# Altium schematic sheet Power_Controller-Sheet.SchDoc (part 3 of 3)
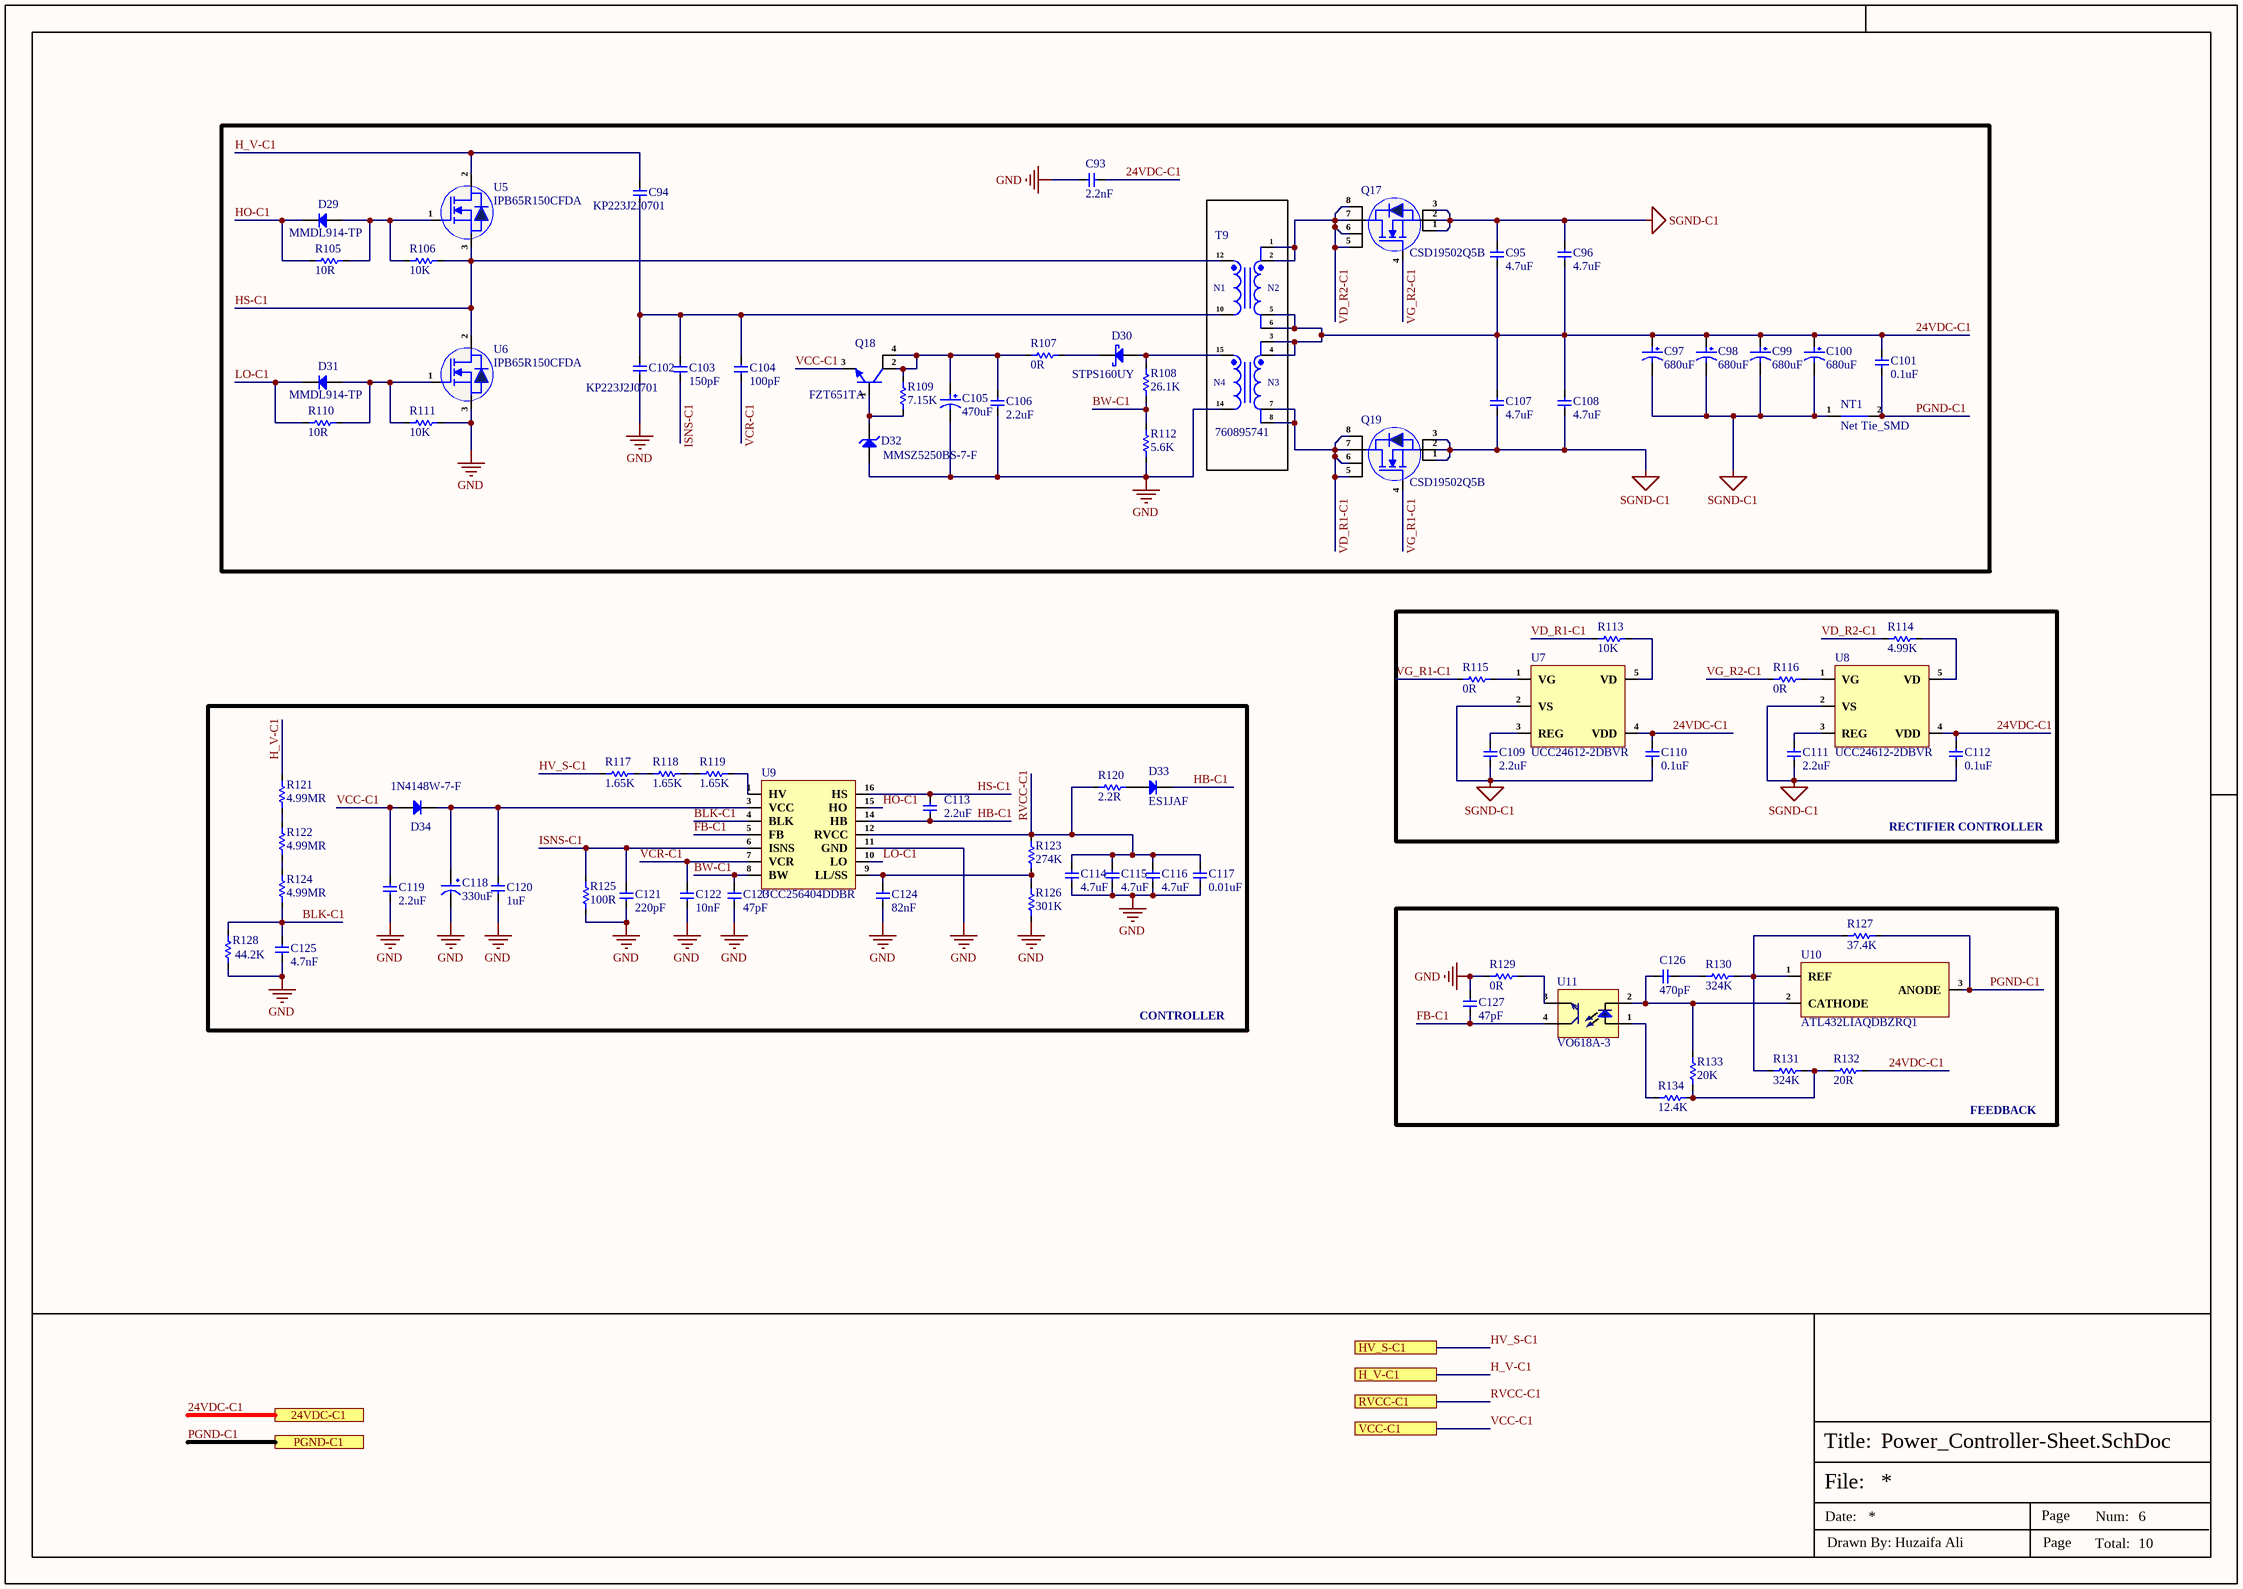
[diagram p2: Power_Controller-Sheet.SchDoc]

## Library data of the parts (continued)
R112 = CRCW08055K60FKEA: RES SMD 5.6K OHM 1% 1/8W 0805; Manufacturer: Vishay; Value: 5.6kR; Max Power Dissipation: 125mW; Temperature Coefficient: 100ppm/°C; Voltage Rating: 150V; Item Type: Resistor; Supplier: Rs; Supplier Part Number: 6791572P; Manufacturer Part Number: CRCW08055K60FKEA; RoHS: Yes; Category: Chip SMD Resistors; Stock: 100250; Pricing: 1250=0.024, 2500=0.013, 4000=0.015, 5000=0.011 (GBP); Case/Package: 0805; Pins: 2; Weight: 0.000194oz; Case Code (Imperial): 0805; Case Code (Metric): 2012; Contact Plating: Tin; Min Operating Temperature: -55°C; Max Operating Temperature: 155°C; Tolerance: 1%; Packaging: Tape and Reel; Number of Terminations: 2; Series: CRCW; Resistor Type: Thick Film; Package Quantity: 5000; Power Rating: 125mW; Termination: SMD/SMT; Voltage Rating (DC): 150V; Features: Automotive AEC-Q200; Technology: THICK FILM; Resistance Tolerance: 1%; Length: 2mm; Width: 1.25mm; Height: 0.45mm; Depth: 1.25mm; Ratings: AEC-Q200; RoHS Compliant: Yes; Reach SVHC Compliant: Unknown; ComponentLink1URL: https://datasheet.ciiva.com/11811/0900766b80d98b26-11811062.pdf?src-supplier=Rs; ComponentLink1Description: https://datasheet.ciiva.com/11811/0900766b80d98b26-11811062.pdf?src-supplier=Rs; ComponentLink2URL: https://datasheet.ciiva.com/2525/dcrcwe3-2525722.pdf?src-supplier=Digi-Key; ComponentLink2Description: https://datasheet.ciiva.com/2525/dcrcwe3-2525722.pdf?src-supplier=Digi-Key; ComponentLink3URL: https://datasheet.ciiva.com/16767/70201119-16767127.pdf?src-supplier=Allied+Electronics; ComponentLink3Description: https://datasheet.ciiva.com/16767/70201119-16767127.pdf?src-supplier=Allied+Electronics; ComponentLink4URL: https://datasheet.ciiva.com/7841/1697337-7841861.pdf?src-supplier=Element14; ComponentLink4Description: https://datasheet.ciiva.com/7841/1697337-7841861.pdf?src-supplier=Element14; ComponentLink5URL: https://datasheet.ciiva.com/26317/fld-crcw-e3-data-en-26317147.pdf?src-supplier=Distrelec; ComponentLink5Description: https://datasheet.ciiva.com/26317/fld-crcw-e3-data-en-26317147.pdf?src-supplier=Distrelec; ComponentLink6URL: https://datasheet.ciiva.com/7841/1697337-7841690.pdf?src-supplier=Element14; ComponentLink6Description: https://datasheet.ciiva.com/7841/1697337-7841690.pdf?src-supplier=Element14; ComponentLink7URL: https://datasheet.ciiva.com/22683/1847332-22683327.pdf?src-supplier=Element14; ComponentLink7Description: https://datasheet.ciiva.com/22683/1847332-22683327.pdf?src-supplier=Element14; ComponentLink8URL: https://datasheet.ciiva.com/2525/dcrcwe3-2525723.pdf?src-supplier=Digi-Key; ComponentLink8Description: https://datasheet.ciiva.com/2525/dcrcwe3-2525723.pdf?src-supplier=Digi-Key; ComponentLink9URL: https://datasheet.ciiva.com/2525/dcrcwe3-2525724.pdf?src-supplier=Digi-Key; ComponentLink9Description: https://datasheet.ciiva.com/2525/dcrcwe3-2525724.pdf?src-supplier=Digi-Key; ComponentLink10URL: https://datasheet.ciiva.com/9065/dcrcwe3-9065422.pdf?src-supplier=Avnet; ComponentLink10Description: https://datasheet.ciiva.com/9065/dcrcwe3-9065422.pdf?src-supplier=Avnet; LCSC Part Number: C844634
R113 = RK73G1JTTD1002F: RES 10K OHM 1% 1/10W 0603; Item Type: Resistor; Value: 10kR; Power Rating: 100mW; Voltage Rating: 75V; Temperature Coefficient: 50ppm/°C; LCSC Part Number: C362180; ComponentLink1Description: LCSC; Supplier: Digi-Key; Supplier Part Number: 2019-RK73G1JTTD1002FCT-ND; RoHS: Yes; Category: Chip SMD Resistors; Stock: 249394; Pricing: 1=0.22, 10=0.118, 50=0.0812, 100=0.0699, 500=0.0513, 1000=0.04545 (USD); Case/Package: 0603; Case Code (Imperial): 0603; Case Code (Metric): 1608; Min Operating Temperature: -55°C; Max Operating Temperature: 125°C; Tolerance: 1%; Packaging: Tape and Reel; Termination: SMD/SMT; Series: RK73G; Construction: Rectangular; Length: 1.6mm; Depth: 0.8mm; Military Standard: Not; RoHS Compliant: Yes; ComponentLink2URL: http://www.mouser.com/ds/2/219/RK73G-9863.pdf?src-supplier=Mouser; ComponentLink2Description: http://www.mouser.com/ds/2/219/RK73G-9863.pdf?src-supplier=Mouser
R114 = CR0603-FX-4991ELF: RES SMD 4.99K OHM 1% 1/10W 0603; Manufacturer: Bourns; Item Type: Resistor; Voltage Rating (DC): 50V; Supplier: Digikey; LCSC Part Number: C203645; Manufacturer Part Number: CR0603-FX-4991ELF; RoHS: Yes; Stock: 84955; Pricing: 1=0.1, 10=0.014, 25=0.0108, 50=0.008, 100=0.0057, 250=0.00456, 500=0.00364, 1000=0.00268 (USD); Thickness: 457um; RoHS Compliant: 5897YesNo; ComponentLink1URL: https://datasheet.ciiva.com/9122/chpreztr-9122757.pdf?src-supplier=Avnet; ComponentLink1Description: https://datasheet.ciiva.com/9122/chpreztr-9122757.pdf?src-supplier=Avnet; ComponentLink2URL: https://datasheet.ciiva.com/6547/chpreztr-6547333.pdf?src-supplier=Digikey; ComponentLink2Description: https://datasheet.ciiva.com/6547/chpreztr-6547333.pdf?src-supplier=Digikey; ComponentLink3URL: https://datasheet.ciiva.com/6547/chpreztr-6547335.pdf?src-supplier=Digikey; ComponentLink3Description: https://datasheet.ciiva.com/6547/chpreztr-6547335.pdf?src-supplier=Digikey
R115 R116 = RC0402FR-070RL: RES 0 OHM JUMPER 1/16W 0402; Manufacturer: Yageo; Item Type: Resistors; Tolerance: 1%; Power Rating: 62.5mW; Voltage Rating: 50V; Temperature Coefficient: 200ppm/°C; Max Power Dissipation: 63mW; Supplier 1: Mouser; Manufacturer Part Number: RC0402FR-070RL; RoHS: Yes; Stock 1: 8556842; Pricing 1: 1=0.10000, 10=0.01400, 50=0.01400, 100=0.00600, 1000=0.00300, 5000=0.00200, 10000=0.00100 (USD); Mount: Surface Mount; Case/Package: 0402; Contact Plating: Tin,Matte; Case Code (Imperial): 0402; Case Code (Metric): 1005; Size Code: 0402; Min Operating Temperature: -55°C; Max Operating Temperature: 155°C; Resistance: 0R; Resistor Type: Thick Film; Packaging: Tape and Reel; Termination: SMD/SMT; Features: Moisture Resistant; Series: RC; Number of Terminations: 2; Length: 1mm; Width: 0.5mm; Height: 0.35mm; Radiation Hardening: No; Lead Free: Lead Free; RoHS Compliant: Yes; ComponentLink1URL: https://datasheet.ciiva.com/8896/pyu-rc0402-51-rohs-l-6-8896149.pdf?src-supplier=Avnet; ComponentLink1Description: https://datasheet.ciiva.com/8896/pyu-rc0402-51-rohs-l-6-8896149.pdf?src-supplier=Avnet; ComponentLink2URL: https://datasheet.ciiva.com/16790/pyu-rc0402-51-rohs-l-6-r-16790444.pdf?src-supplier=Future+Electronics; ComponentLink2Description: https://datasheet.ciiva.com/16790/pyu-rc0402-51-rohs-l-6-r-16790444.pdf?src-supplier=Future+Electronics; Supplier Part Number 1: 603-RC0402FR-070RL; LCSC Part Number: C106231
R117-R119 = RC1206FR-071K65L: RES 1.65K OHM 1% 1/4W 1206; Manufacturer: Yageo; Item Type: Resistor; Supplier: Digikey; LCSC Part Number: C488588; Manufacturer Part Number: RC1206FR-071K65L; RoHS: Yes; Stock: 18321; Pricing: 1=0.1, 10=0.038, 50=0.0244, 100=0.0206, 500=0.01434, 1000=0.01248 (USD); ComponentLink1URL: https://datasheet.ciiva.com/15159/getdatasheetpartid-45723-15159541.pdf?src-supplier=Verical; ComponentLink1Description: https://datasheet.ciiva.com/15159/getdatasheetpartid-45723-15159541.pdf?src-supplier=Verical; ComponentLink2URL: https://datasheet.ciiva.com/17086/pyu-rc1206-51-rohs-l-4-17086185.pdf?src-supplier=Future+Electronics; ComponentLink2Description: https://datasheet.ciiva.com/17086/pyu-rc1206-51-rohs-l-4-17086185.pdf?src-supplier=Future+Electronics
R120 = RC0603FR-072R2L: RES 2.2 OHM 1% 1/10W 0603; Manufacturer: Yageo; Item Type: Resistors; Voltage Rating: 50V; Power Rating: 100mW; Temperature Coefficient: 200ppm/°C; Supplier: Digikey; LCSC Part Number: C112307; Manufacturer Part Number: RC0603FR-072R2L; RoHS: Yes; Stock: 331140; Pricing: 1=0.1, 10=0.029, 50=0.0188, 100=0.0158, 500=0.01094, 1000=0.00947 (USD); Case/Package: 0603; Pins: 2; Case Code (Metric): 1608; Case Code (Imperial): 0603; Min Operating Temperature: -55°C; Max Operating Temperature: 155°C; Voltage Rating (DC): 50V; Package Quantity: 1; Value: 2.2R; Tolerance: 1%; Packaging: Tape and Reel; Resistor Type: Thick Film; Number of Terminations: 2; Termination: SMD/SMT; Max Power Dissipation: 100mW; Features: Moisture Resistant; Series: RC; Technology: THICK FILM; Resistance Tolerance: 1%; Length: 0.063inch; Width: 0.031inch; Height: 0.022inch; Depth: 0.8mm; Reach SVHC Compliant: No; Lead Free: Lead Free; RoHS Compliant: Yes; ComponentLink1URL: https://datasheet.ciiva.com/11808/0900766b80f96399-11808160.pdf?src-supplier=Rs; ComponentLink1Description: https://datasheet.ciiva.com/11808/0900766b80f96399-11808160.pdf?src-supplier=Rs; ComponentLink2URL: https://datasheet.ciiva.com/2554/pyu-r-int-thick-7-2554421.pdf?src-supplier=Digikey; ComponentLink2Description: https://datasheet.ciiva.com/2554/pyu-r-int-thick-7-2554421.pdf?src-supplier=Digikey; ComponentLink3URL: https://datasheet.ciiva.com/2554/pyu-r-int-thick-7-2554422.pdf?src-supplier=Digikey; ComponentLink3Description: https://datasheet.ciiva.com/2554/pyu-r-int-thick-7-2554422.pdf?src-supplier=Digikey; ComponentLink4URL: https://datasheet.ciiva.com/2554/pyu-r-int-thick-7-2554420.pdf?src-supplier=Digikey; ComponentLink4Description: https://datasheet.ciiva.com/2554/pyu-r-int-thick-7-2554420.pdf?src-supplier=Digikey
R121 R122 R124 = RC1206FR-074M99L: RES 4.99M OHM 1% 1/4W 1206; Manufacturer: Yageo; Item Type: Resistors; Temperature Coefficient: 100ppm/°C; Power Rating: 250mW; Voltage Rating: 200V; Supplier: Digikey; LCSC Part Number: C488845; Manufacturer Part Number: RC1206FR-074M99L; RoHS: Yes; Stock: 11560; Pricing: 1=0.1, 10=0.038, 50=0.0244, 100=0.0206, 500=0.01434, 1000=0.01248 (USD); Case/Package: 1206; Contact Plating: Tin,Matte; Case Code (Imperial): 1206; Case Code (Metric): 3216; Min Operating Temperature: -55°C; Max Operating Temperature: 155°C; Tolerance: 1%; Value: 4.99MR; Package Quantity: 1; Packaging: Tape and Reel; Termination: SMD/SMT; Number of Terminations: 2; Max Power Dissipation: 250mW; Voltage Rating (DC): 200V; Features: Moisture Resistant; Series: RC; Length: 0.122inch; Width: 0.063inch; Height: 0.026inch; Lead Free: Lead Free; RoHS Compliant: Yes; ComponentLink1URL: https://datasheet.ciiva.com/2521/pyu-rc1206-51-rohs-l-4-2521020.pdf?src-supplier=Digikey; ComponentLink1Description: https://datasheet.ciiva.com/2521/pyu-rc1206-51-rohs-l-4-2521020.pdf?src-supplier=Digikey; ComponentLink2URL: https://datasheet.ciiva.com/2521/pyu-rc1206-51-rohs-l-4-2521021.pdf?src-supplier=Digikey; ComponentLink2Description: https://datasheet.ciiva.com/2521/pyu-rc1206-51-rohs-l-4-2521021.pdf?src-supplier=Digikey; ComponentLink3URL: https://datasheet.ciiva.com/2521/pyu-rc1206-51-rohs-l-4-2521019.pdf?src-supplier=Digikey; ComponentLink3Description: https://datasheet.ciiva.com/2521/pyu-rc1206-51-rohs-l-4-2521019.pdf?src-supplier=Digikey
R123 = RC0603FR-07274KL: RES 274K OHM 1% 1/10W 0603; Manufacturer: Yageo; Item Type: Resistors; Supplier: Digikey; LCSC Part Number: C482818; Manufacturer Part Number: RC0603FR-07274KL; RoHS: Yes; Stock: 204071; Pricing: 1=0.1, 10=0.019, 50=0.0114, 100=0.0094, 500=0.00632, 1000=0.0054 (USD); ComponentLink1URL: https://datasheet.ciiva.com/2454/pyu-r-int-thick-7-2454960.pdf?src-supplier=Digikey; ComponentLink1Description: https://datasheet.ciiva.com/2454/pyu-r-int-thick-7-2454960.pdf?src-supplier=Digikey; ComponentLink2URL: https://datasheet.ciiva.com/2454/pyu-r-int-thick-7-2454961.pdf?src-supplier=Digikey; ComponentLink2Description: https://datasheet.ciiva.com/2454/pyu-r-int-thick-7-2454961.pdf?src-supplier=Digikey; ComponentLink3URL: https://datasheet.ciiva.com/2454/pyu-r-int-thick-7-2454962.pdf?src-supplier=Digikey; ComponentLink3Description: https://datasheet.ciiva.com/2454/pyu-r-int-thick-7-2454962.pdf?src-supplier=Digikey
R125 = CRCW0603100RFKEA: RES SMD 100 OHM 1% 1/10W 0603; Manufacturer: Vishay Dale; Item Type: Resistors; Power Rating: 100mW; Voltage Rating: 75V; Temperature Coefficient: 100ppm/°C; Supplier: Mouser; LCSC Part Number: C844917; Manufacturer Part Number: CRCW0603100RFKEA; RoHS: Yes; Stock: 584918; Pricing: 1=0.1, 10=0.017, 50=0.017, 100=0.01, 1000=0.008, 10000=0.004 (USD); Case/Package: 0603; Pins: 2NUMBER; Weight: 7.1E-05oz; Case Code (Metric): 1608; Case Code (Imperial): 0603; Min Operating Temperature: -55°C; Max Operating Temperature: 155°C; Value: 100R; Tolerance: 1%; Resistor Type: Thick Film; Package Quantity: 10; Packaging: Tape and Reel; Number of Terminations: 2; Termination: SMD/SMT; Max Power Dissipation: 100mW; Features: Automotive AEC-Q200; Series: CRCW; Resistance Tolerance: 1%; Voltage Rating (DC): 75V; Construction: Rectangular; Length: 1.55mm; Width: 0.033inch; Height: 0.02inch; Depth: 0.85mm; Ratings: AEC-Q200; Lead Free: 5697LeadFree; RoHS Compliant: Yes; Reach SVHC Compliant: Unknown; Military Standard: Not; ComponentLink1URL: https://datasheet.ciiva.com/22666/1720486-22666207.pdf?src-supplier=Element14; ComponentLink1Description: https://datasheet.ciiva.com/22666/1720486-22666207.pdf?src-supplier=Element14; ComponentLink2URL: https://datasheet.ciiva.com/26316/fld-crcw-e3-data-en-26316566.pdf?src-supplier=Distrelec; ComponentLink2Description: https://datasheet.ciiva.com/26316/fld-crcw-e3-data-en-26316566.pdf?src-supplier=Distrelec; ComponentLink3URL: https://datasheet.ciiva.com/22673/1697337-22673066.pdf?src-supplier=Element14; ComponentLink3Description: https://datasheet.ciiva.com/22673/1697337-22673066.pdf?src-supplier=Element14; ComponentLink4URL: https://datasheet.ciiva.com/2465/dcrcwe3-2465544.pdf?src-supplier=Digikey; ComponentLink4Description: https://datasheet.ciiva.com/2465/dcrcwe3-2465544.pdf?src-supplier=Digikey; ComponentLink5URL: https://datasheet.ciiva.com/2465/dcrcwe3-2465545.pdf?src-supplier=Digikey; ComponentLink5Description: https://datasheet.ciiva.com/2465/dcrcwe3-2465545.pdf?src-supplier=Digikey; ComponentLink6URL: https://datasheet.ciiva.com/2465/dcrcwe3-2465543.pdf?src-supplier=Digikey; ComponentLink6Description: https://datasheet.ciiva.com/2465/dcrcwe3-2465543.pdf?src-supplier=Digikey; ComponentLink7URL: https://datasheet.ciiva.com/16721/70201119-16721486.pdf?src-supplier=Allied+Electronics; ComponentLink7Description: https://datasheet.ciiva.com/16721/70201119-16721486.pdf?src-supplier=Allied+Electronics; ComponentLink8URL: https://datasheet.ciiva.com/16787/70201119-16787964.pdf?src-supplier=Allied+Electronics; ComponentLink8Description: https://datasheet.ciiva.com/16787/70201119-16787964.pdf?src-supplier=Allied+Electronics; ComponentLink9URL: https://datasheet.ciiva.com/5550/dcrcwe3-109170-5550286.pdf?src-supplier=Mouser; ComponentLink9Description: https://datasheet.ciiva.com/5550/dcrcwe3-109170-5550286.pdf?src-supplier=Mouser; ComponentLink10URL: https://datasheet.ciiva.com/16199/dcrcwe3-16199102.pdf?src-supplier=Future+Electronics; ComponentLink10Description: https://datasheet.ciiva.com/16199/dcrcwe3-16199102.pdf?src-supplier=Future+Electronics
R126 = RT0603BRE07301KL: RES SMD 301K OHM 0.1% 1/10W 0603; Manufacturer: Yageo; Resistance: 301kR; Max Power Dissipation: 100mW; Temperature Coefficient: 50ppm/°C; Voltage Rating (DC): 50V; Item Type: Resistor; Supplier 1: Mouser; Manufacturer Part Number: RT0603BRE07301KL; RoHS: Yes; Category: Chip SMD Resistors; Stock 1: 2800; Pricing 1: 1=0.42000, 10=0.30200, 50=0.30200, 100=0.12100, 1000=0.06000, 10000=0.04900 (USD); Case/Package: 0603; Min Operating Temperature: -55°C; Max Operating Temperature: 125°C; Package Quantity: 5000; Packaging: Tape and Reel; Tolerance: 0.1%; Resistor Type: Thin Film; Number of Terminations: 2; Series: RT; Length: 0.063inch; Width: 0.031inch; Height: 0.022inch; Lead Free: Lead Free; RoHS Compliant: Yes; ComponentLink1URL: https://datasheet.ciiva.com/2584/pyu-rt-1-to-0-05-rohs-l-5-2584420.pdf?src-supplier=Digi-Key; ComponentLink1Description: https://datasheet.ciiva.com/2584/pyu-rt-1-to-0-05-rohs-l-5-2584420.pdf?src-supplier=Digi-Key; Supplier Part Number 1: 603-RT0603BRE07301KL; LCSC Part Number: C326750
R127 = CRCW060337K4FKEA: RES SMD 37.4K OHM 1% 1/10W 0603; Manufacturer: Vishay; Item Type: Resistor; Supplier: Digikey; LCSC Part Number: C844359; Manufacturer Part Number: CRCW060337K4FKEA; RoHS: Yes; Stock: 9664; Pricing: 1=0.1, 10=0.026, 50=0.0166, 100=0.014, 500=0.00954, 1000=0.00824 (USD); ComponentLink1URL: https://datasheet.ciiva.com/5541/dcrcwe3-109170-5541061.pdf?src-supplier=Mouser; ComponentLink1Description: https://datasheet.ciiva.com/5541/dcrcwe3-109170-5541061.pdf?src-supplier=Mouser; ComponentLink2URL: https://datasheet.ciiva.com/22705/1697337-22705851.pdf?src-supplier=Element14; ComponentLink2Description: https://datasheet.ciiva.com/22705/1697337-22705851.pdf?src-supplier=Element14; ComponentLink3URL: https://datasheet.ciiva.com/16770/70201119-16770680.pdf?src-supplier=Allied+Electronics; ComponentLink3Description: https://datasheet.ciiva.com/16770/70201119-16770680.pdf?src-supplier=Allied+Electronics; ComponentLink4URL: https://datasheet.ciiva.com/7671/1697337-7671645.pdf?src-supplier=Element14; ComponentLink4Description: https://datasheet.ciiva.com/7671/1697337-7671645.pdf?src-supplier=Element14; ComponentLink5URL: https://datasheet.ciiva.com/7671/1697337-7671646.pdf?src-supplier=Element14; ComponentLink5Description: https://datasheet.ciiva.com/7671/1697337-7671646.pdf?src-supplier=Element14; ComponentLink6URL: https://datasheet.ciiva.com/3257/dcrcwe3-3257503.pdf?src-supplier=Avnet; ComponentLink6Description: https://datasheet.ciiva.com/3257/dcrcwe3-3257503.pdf?src-supplier=Avnet; ComponentLink7URL: https://datasheet.ciiva.com/7792/125364-7792237.pdf?src-supplier=Element14; ComponentLink7Description: https://datasheet.ciiva.com/7792/125364-7792237.pdf?src-supplier=Element14; ComponentLink8URL: https://datasheet.ciiva.com/16203/dcrcwe3-16203015.pdf?src-supplier=Future+Electronics; ComponentLink8Description: https://datasheet.ciiva.com/16203/dcrcwe3-16203015.pdf?src-supplier=Future+Electronics; ComponentLink9URL: https://datasheet.ciiva.com/2465/dcrcwe3-2465762.pdf?src-supplier=Digikey; ComponentLink9Description: https://datasheet.ciiva.com/2465/dcrcwe3-2465762.pdf?src-supplier=Digikey; ComponentLink10URL: https://datasheet.ciiva.com/2465/dcrcwe3-2465763.pdf?src-supplier=Digikey; ComponentLink10Description: https://datasheet.ciiva.com/2465/dcrcwe3-2465763.pdf?src-supplier=Digikey; ComponentLink11URL: https://datasheet.ciiva.com/2465/dcrcwe3-2465764.pdf?src-supplier=Digikey; ComponentLink11Description: https://datasheet.ciiva.com/2465/dcrcwe3-2465764.pdf?src-supplier=Digikey; ComponentLink12URL: https://datasheet.ciiva.com/8337/dcrcwe3-8337085.pdf?src-supplier=Avnet; ComponentLink12Description: https://datasheet.ciiva.com/8337/dcrcwe3-8337085.pdf?src-supplier=Avnet
R128 = CRCW060344K2FKEA: RES SMD 44.2K OHM 1% 1/10W 0603; Manufacturer: Vishay; Item Type: Resistor; Voltage Rating (DC): 75V; Supplier: Digikey; LCSC Part Number: C844365; Manufacturer Part Number: CRCW060344K2FKEA; RoHS: Yes; Stock: 24979; Pricing: 1=0.1, 10=0.026, 50=0.0166, 100=0.014, 500=0.00954, 1000=0.00824 (USD); Lead Free: 5697LeadFree; ComponentLink1URL: https://datasheet.ciiva.com/11812/0900766b80d98afc-11812612.pdf?src-supplier=Rs; ComponentLink1Description: https://datasheet.ciiva.com/11812/0900766b80d98afc-11812612.pdf?src-supplier=Rs; ComponentLink2URL: https://datasheet.ciiva.com/2466/dcrcwe3-2466281.pdf?src-supplier=Digikey; ComponentLink2Description: https://datasheet.ciiva.com/2466/dcrcwe3-2466281.pdf?src-supplier=Digikey; ComponentLink3URL: https://datasheet.ciiva.com/2466/dcrcwe3-2466282.pdf?src-supplier=Digikey; ComponentLink3Description: https://datasheet.ciiva.com/2466/dcrcwe3-2466282.pdf?src-supplier=Digikey; ComponentLink4URL: https://datasheet.ciiva.com/2466/dcrcwe3-2466283.pdf?src-supplier=Digikey; ComponentLink4Description: https://datasheet.ciiva.com/2466/dcrcwe3-2466283.pdf?src-supplier=Digikey; ComponentLink5URL: https://datasheet.ciiva.com/15159/getdatasheetpartid-52050-15159597.pdf?src-supplier=Verical; ComponentLink5Description: https://datasheet.ciiva.com/15159/getdatasheetpartid-52050-15159597.pdf?src-supplier=Verical; ComponentLink6URL: https://datasheet.ciiva.com/16507/dcrcwe3-16507773.pdf?src-supplier=Future+Electronics; ComponentLink6Description: https://datasheet.ciiva.com/16507/dcrcwe3-16507773.pdf?src-supplier=Future+Electronics; ComponentLink7URL: https://datasheet.ciiva.com/22705/1697337-22705852.pdf?src-supplier=Element14; ComponentLink7Description: https://datasheet.ciiva.com/22705/1697337-22705852.pdf?src-supplier=Element14; ComponentLink8URL: https://datasheet.ciiva.com/7671/1697337-7671657.pdf?src-supplier=Element14; ComponentLink8Description: https://datasheet.ciiva.com/7671/1697337-7671657.pdf?src-supplier=Element14; ComponentLink9URL: https://datasheet.ciiva.com/7671/1697337-7671658.pdf?src-supplier=Element14; ComponentLink9Description: https://datasheet.ciiva.com/7671/1697337-7671658.pdf?src-supplier=Element14; ComponentLink10URL: https://datasheet.ciiva.com/16772/70201119-16772373.pdf?src-supplier=Allied+Electronics; ComponentLink10Description: https://datasheet.ciiva.com/16772/70201119-16772373.pdf?src-supplier=Allied+Electronics; ComponentLink11URL: https://datasheet.ciiva.com/22872/70201119-22872024.pdf?src-supplier=Allied+Electronics; ComponentLink11Description: https://datasheet.ciiva.com/22872/70201119-22872024.pdf?src-supplier=Allied+Electronics
R129 = RC0603JR-070RL: RES 0 OHM JUMPER 1/10W 0603; Manufacturer: Yageo; Resistance: 0mR; Tolerance: 1%; Power Rating: 100mW; Voltage Rating (DC): 50V; Temperature Coefficient: 200ppm/°C; Resistance Tolerance: 5%; Item Type: Resistor; Supplier 1: Digi-Key; Manufacturer Part Number: RC0603JR-070RL; RoHS: Yes; Category: Chip SMD Resistors; Stock 1: 18081776; Pricing 1: 1=0.10000, 10=0.01700, 25=0.01240, 50=0.00960, 100=0.00700, 250=0.00536, 500=0.00430, 1000=0.00316 (USD); Case/Package: 0603; Number of Pins: 2; Contact Plating: Tin,Matte; Case Code (Imperial): 0603; Case Code (Metric): 1608; Size Code: 0603; Min Operating Temperature: -55°C; Max Operating Temperature: 155°C; Resistor Type: Thick Film; Packaging: Tape and Reel; Termination: SMD/SMT; Series: RC; Technology: THICK FILM; Package Quantity: 5000; Voltage Rating: 50V; Features: Moisture Resistant; Max Power Dissipation: 100mW; Number of Terminations: 2; Construction: Rectangular; Length: 1.6mm; Width: 0.8mm; Height: 0.45mm; Depth: 0.8mm; Radiation Hardening: No; Reach SVHC Compliant: No SVHC; Lead Free: Lead Free; RoHS Compliant: Yes; Military Standard: Not; Supplier Part Number 1: 311-0.0GRCT-ND; LCSC Part Number: C95177
R130 R131 = AC0603FR-07324KL: RES SMD 324K OHM 1% 1/10W 0603; Manufacturer: Yageo; Item Type: Resistors; Value: 324kR; Power Rating: 100mW; Voltage Rating: 50V; Temperature Coefficient: 100ppm/°C; Supplier: Digikey; LCSC Part Number: C227818; Manufacturer Part Number: AC0603FR-07324KL; RoHS: Yes; Stock: 5000; Pricing: 1=0.1, 10=0.021, 50=0.013, 100=0.0108, 500=0.00734, 1000=0.00633 (USD); Case/Package: 0603; Case Code (Metric): 1608; Case Code (Imperial): 0603; Min Operating Temperature: -55°C; Max Operating Temperature: 155°C; Package Quantity: 1; Tolerance: 1%; Packaging: Tape and Reel; Number of Terminations: 2; Termination: SMD/SMT; Max Power Dissipation: 100mW; Features: Moisture Resistant,Automotive AEC-Q200,Anti-Sulfur; Series: AC; Length: 0.063inch; Width: 0.031inch; Height: 0.022inch; RoHS Compliant: Yes; ComponentLink1URL: http://www.mouser.com/ds/2/447/yageodocoutput-1111992.pdf?src-supplier=Mouser; ComponentLink1Description: http://www.mouser.com/ds/2/447/yageodocoutput-1111992.pdf?src-supplier=Mouser; ComponentLink2URL: https://www.yageo.com/upload/media/product/productsearch/datasheet/rchip/PYu-AC_51_RoHS_L_7.pdf?src-supplier=Digikey; ComponentLink2Description: https://www.yageo.com/upload/media/product/productsearch/datasheet/rchip/PYu-AC_51_RoHS_L_7.pdf?src-supplier=Digikey
R132 = CRCW060320R0FKEA: RES SMD 20 OHM 1% 1/10W 0603; Manufacturer: Vishay; Item Type: Resistors; Temperature Coefficient: 100ppm/°C; Power Rating: 100mW; Voltage Rating: 75V; Supplier: Digikey; LCSC Part Number: C844755; Manufacturer Part Number: CRCW060320R0FKEA; RoHS: Yes; Stock: 100733; Pricing: 1=0.1, 10=0.026, 50=0.0166, 100=0.014, 500=0.00954, 1000=0.00824 (USD); Case/Package: 0603; Contact Plating: Tin; Weight: 7.1E-05oz; Case Code (Imperial): 0603; Case Code (Metric): 1608; Min Operating Temperature: -55°C; Max Operating Temperature: 155°C; Value: 20R; Tolerance: 1%; Resistor Type: Thick Film; Package Quantity: 10; Packaging: Tape and Reel; Number of Terminations: 2; Termination: SMD/SMT; Max Power Dissipation: 100mW; Voltage Rating (DC): 75V; Features: Automotive AEC-Q200; Series: CRCW; Technology: THICK FILM; Resistance Tolerance: 1%; Construction: Rectangular; Length: 1.55mm; Width: 0.033inch; Height: 0.45mm; Depth: 0.85mm; Ratings: AEC-Q200; Radiation Hardening: No; Lead Free: Lead Free; RoHS Compliant: Yes; Military Standard: Not; Reach SVHC Compliant: Unknown; ComponentLink1URL: https://datasheet.ciiva.com/11810/0900766b80d98afc-11810778.pdf?src-supplier=Rs; ComponentLink1Description: https://datasheet.ciiva.com/11810/0900766b80d98afc-11810778.pdf?src-supplier=Rs; ComponentLink2URL: https://datasheet.ciiva.com/7748/1533075-7748858.pdf?src-supplier=Element14; ComponentLink2Description: https://datasheet.ciiva.com/7748/1533075-7748858.pdf?src-supplier=Element14; ComponentLink3URL: https://datasheet.ciiva.com/2465/dcrcwe3-2465673.pdf?src-supplier=Digikey; ComponentLink3Description: https://datasheet.ciiva.com/2465/dcrcwe3-2465673.pdf?src-supplier=Digikey; ComponentLink4URL: https://datasheet.ciiva.com/2465/dcrcwe3-2465674.pdf?src-supplier=Digikey; ComponentLink4Description: https://datasheet.ciiva.com/2465/dcrcwe3-2465674.pdf?src-supplier=Digikey; ComponentLink5URL: https://datasheet.ciiva.com/16776/70201119-16776202.pdf?src-supplier=Allied+Electronics; ComponentLink5Description: https://datasheet.ciiva.com/16776/70201119-16776202.pdf?src-supplier=Allied+Electronics; ComponentLink6URL: https://datasheet.ciiva.com/26316/fld-crcw-e3-data-en-26316589.pdf?src-supplier=Distrelec; ComponentLink6Description: https://datasheet.ciiva.com/26316/fld-crcw-e3-data-en-26316589.pdf?src-supplier=Distrelec; ComponentLink7URL: https://datasheet.ciiva.com/2465/dcrcwe3-2465672.pdf?src-supplier=Digikey; ComponentLink7Description: https://datasheet.ciiva.com/2465/dcrcwe3-2465672.pdf?src-supplier=Digikey; ComponentLink8URL: https://datasheet.ciiva.com/16788/70201119-16788011.pdf?src-supplier=Allied+Electronics; ComponentLink8Description: https://datasheet.ciiva.com/16788/70201119-16788011.pdf?src-supplier=Allied+Electronics; ComponentLink9URL: https://datasheet.ciiva.com/5548/dcrcwe3-109170-5548022.pdf?src-supplier=Mouser; ComponentLink9Description: https://datasheet.ciiva.com/5548/dcrcwe3-109170-5548022.pdf?src-supplier=Mouser; ComponentLink10URL: https://datasheet.ciiva.com/3257/dcrcwe3-3257244.pdf?src-supplier=Avnet; ComponentLink10Description: https://datasheet.ciiva.com/3257/dcrcwe3-3257244.pdf?src-supplier=Avnet; ComponentLink11URL: https://datasheet.ciiva.com/16374/dcrcwe3-16374634.pdf?src-supplier=Future+Electronics; ComponentLink11Description: https://datasheet.ciiva.com/16374/dcrcwe3-16374634.pdf?src-supplier=Future+Electronics; ComponentLink12URL: https://datasheet.ciiva.com/3257/dcrcwe3-3257243.pdf?src-supplier=Avnet; ComponentLink12Description: https://datasheet.ciiva.com/3257/dcrcwe3-3257243.pdf?src-supplier=Avnet
R133 = RC1206FR-0720KL: RES 20K OHM 1% 1/4W 1206; Manufacturer: Yageo; Item Type: Resistors; Voltage Rating (DC): 200V; Supplier: Digikey; LCSC Part Number: C114940; Manufacturer Part Number: RC1206FR-0720KL; RoHS: Yes; Stock: 286094; Pricing: 1=0.1, 10=0.038, 50=0.0244, 100=0.0206, 500=0.01434, 1000=0.01248 (USD); Lead Free: 5697LeadFree; ComponentLink1URL: https://datasheet.ciiva.com/11809/0900766b80c6630a-11809460.pdf?src-supplier=Rs; ComponentLink1Description: https://datasheet.ciiva.com/11809/0900766b80c6630a-11809460.pdf?src-supplier=Rs; ComponentLink2URL: https://datasheet.ciiva.com/16746/pyu-rc1206-51-rohs-l-4-16746334.pdf?src-supplier=Future+Electronics; ComponentLink2Description: https://datasheet.ciiva.com/16746/pyu-rc1206-51-rohs-l-4-16746334.pdf?src-supplier=Future+Electronics
R134 = CRCW060312K4FKEA: RES SMD 12.4K OHM 1% 1/10W 0603; Manufacturer: Vishay; Item Type: Resistors; Value: 12.4kR; Temperature Coefficient: 100ppm/°C; Voltage Rating: 75V; Power Rating: 100mW; Supplier: Digikey; LCSC Part Number: C844524; Manufacturer Part Number: CRCW060312K4FKEA; RoHS: Yes; Stock: 12301; Pricing: 1=0.1, 10=0.026, 50=0.0166, 100=0.014, 500=0.00954, 1000=0.00824 (USD); Case/Package: 345Case; Pins: 2NUMBER; Case Code (Imperial): 0603; Case Code (Metric): 1608; Min Operating Temperature: -55°C; Max Operating Temperature: 155°C; Tolerance: 1%; Resistor Type: Thick Film; Packaging: 13Packaging; Resistance Tolerance: 1%; Height: 500um; Lead Free: 5697LeadFree; RoHS Compliant: Yes; ComponentLink1URL: http://www.farnell.com/datasheets/2310790.pdf?src-supplier=Farnell; ComponentLink1Description: http://www.farnell.com/datasheets/2310790.pdf?src-supplier=Farnell; ComponentLink2URL: https://datasheet.octopart.com/CRCW060312K4FKEA-Vishay-datasheet-62317933.pdf?src-supplier=Element14; ComponentLink2Description: https://datasheet.octopart.com/CRCW060312K4FKEA-Vishay-datasheet-62317933.pdf?src-supplier=Element14; ComponentLink3URL: http://www.farnell.com/datasheets/2310790.pdf?src-supplier=Newark; ComponentLink3Description: http://www.farnell.com/datasheets/2310790.pdf?src-supplier=Newark; ComponentLink4URL: https://datasheet.octopart.com/CRCW060312K4FKEA-Vishay-datasheet-5300368.pdf?src-supplier=Future+Electronics; ComponentLink4Description: https://datasheet.octopart.com/CRCW060312K4FKEA-Vishay-datasheet-5300368.pdf?src-supplier=Future+Electronics; ComponentLink5URL: http://www.farnell.com/datasheets/2310790.pdf?src-supplier=Element14; ComponentLink5Description: http://www.farnell.com/datasheets/2310790.pdf?src-supplier=Element14; ComponentLink6URL: https://datasheet.octopart.com/CRCW060312K4FKEA-Vishay-datasheet-83961561.pdf?src-supplier=Newark; ComponentLink6Description: https://datasheet.octopart.com/CRCW060312K4FKEA-Vishay-datasheet-83961561.pdf?src-supplier=Newark
T9 = 760895741: XFMR RES CONV AC/DC 400UH TH; Manufacturer: Wurth Electronics; Item Type: Transformer; Frequency: 120kHz; Current Rating: 10.4A; Power Rating: 250W; Shielding: Unshielded; Output Voltage: 24V; Supplier: Digikey; Supplier Part Number: 732-5069-ND; Manufacturer Part Number: 760895741; RoHS: Yes; Stock: 7; Pricing: 1=22.74, 10=21.792, 50=20.43, 100=18.3881, 500=15.66304 (USD); Mounting Technology: Through Hole; Min Operating Temperature: -40°C; Max Operating Temperature: 125°C; Package Quantity: 20; Output Current: 10.4A; Packaging: Tray; Termination: Solder; Value: 400uH; Series: WE-LLCR; Length: 48mm; Width: 35mm; Height: 27.5mm; RoHS Compliant: Yes; ComponentLink1URL: https://datasheet.ciiva.com/24142/760895741-270531-24142074.pdf?src-supplier=Mouser; ComponentLink1Description: https://datasheet.ciiva.com/24142/760895741-270531-24142074.pdf?src-supplier=Mouser; ComponentLink2URL: https://datasheet.ciiva.com/29632/760895741-29632482.pdf?src-supplier=Digikey; ComponentLink2Description: https://datasheet.ciiva.com/29632/760895741-29632482.pdf?src-supplier=Digikey
U5 U6 = IPB65R150CFDA: MOSFET N-CH 650V 22.4A D2PAK; Manufacturer: Infineon; Supplier: Future Electronics; LCSC Part Number: C536639; Manufacturer Part Number: IPB65R150CFDA; Item Type: Mosfet; Stock: 1000; Pricing: 1000=2.73 (USD); Case/Package: TO-263-3; Pins: 3; Packaging: Tape and Reel; Halogen Free: Halogen Free
U7 U8 = UCC24612-2DBVR: SYNC RECTIFIER FLYBACK; Manufacturer: Texas Instruments; Item Type: IC; Supplier: Mouser; LCSC Part Number: C471044; Manufacturer Part Number: UCC24612-2DBVR; RoHS: Yes; Stock: 6284; Pricing: 1=0.92, 10=0.758, 50=0.758, 100=0.575, 1000=0.392, 10000=0.317 (USD); Pins: 5NUMBER; Length: 2.9mm; Width: 1.6mm; Height: 1.45mm; Thickness: 1.2mm; ComponentLink1URL: http://www.ti.com/general/docs/suppproductinfo.tsp?distId=10&amp;gotoUrl=http%3A%2F%2Fwww.ti.com%2Flit%2Fgpn%2Fucc24612&src-supplier=Digikey; ComponentLink1Description: http://www.ti.com/general/docs/suppproductinfo.tsp?distId=10&amp;gotoUrl=http%3A%2F%2Fwww.ti.com%2Flit%2Fgpn%2Fucc24612&src-supplier=Digikey
U9 = UCC256404DDBR: HALF BRIDGE CONT WITH HV DRIVER; Manufacturer: Texas Instruments; Item Type: IC; Supplier: Mouser; LCSC Part Number: C2867939; Manufacturer Part Number: UCC256404DDBR; RoHS: Yes; Stock: 2756; Pricing: 1=2.34, 10=1.99, 50=1.99, 100=1.69, 1000=1.15, 10000=0.981 (USD); ComponentLink1URL: http://www.ti.com/general/docs/suppproductinfo.tsp?distId=10&amp;gotoUrl=http%3A%2F%2Fwww.ti.com%2Flit%2Fgpn%2Fucc256402&src-supplier=Digikey; ComponentLink1Description: http://www.ti.com/general/docs/suppproductinfo.tsp?distId=10&amp;gotoUrl=http%3A%2F%2Fwww.ti.com%2Flit%2Fgpn%2Fucc256402&src-supplier=Digikey
U10 = ATL432LIAQDBZRQ1: IC VREF SHUNT ADJ 1% SOT23-3; Manufacturer: Texas Instruments; Supplier: Digikey; LCSC Part Number: C1852128; Manufacturer Part Number: ATL432LIAQDBZRQ1; RoHS: Yes; Item Type: IC; Stock: 1265; Pricing: 1=0.61, 10=0.523, 25=0.488, 100=0.3903, 250=0.3624, 500=0.30664, 1000=0.23695 (USD); ComponentLink1URL: http://www.ti.com/general/docs/suppproductinfo.tsp?distId=10&amp;gotoUrl=http%3A%2F%2Fwww.ti.com%2Flit%2Fgpn%2Fatl431li-q1&src-supplier=Digikey; ComponentLink1Description: http://www.ti.com/general/docs/suppproductinfo.tsp?distId=10&amp;gotoUrl=http%3A%2F%2Fwww.ti.com%2Flit%2Fgpn%2Fatl431li-q1&src-supplier=Digikey
U11 = VO618A-3: Optocoupler DC-IN 1-CH Transistor DC-OUT 4-Pin PDIP; Manufacturer: Vishay Semiconductors; Item Type: Optocouplers; Supplier: Digikey; LCSC Part Number: C142630; Manufacturer Part Number: VO618A-3; RoHS: Yes; Stock: 6419; Pricing: 1=0.46, 10=0.283, 100=0.1626, 1000=0.12726, 2000=0.11666, 5000=0.10605, 10000=0.09898, 25000=0.09544 (USD); ComponentLink1URL: https://datasheet.ciiva.com/26941/getdatasheetpartid-641306-26941970.pdf?src-supplier=Verical; ComponentLink1Description: https://datasheet.ciiva.com/26941/getdatasheetpartid-641306-26941970.pdf?src-supplier=Verical; ComponentLink2URL: https://datasheet.ciiva.com/2087/vo618a-2087569.pdf?src-supplier=Digikey; ComponentLink2Description: https://datasheet.ciiva.com/2087/vo618a-2087569.pdf?src-supplier=Digikey; ComponentLink3URL: https://datasheet.ciiva.com/8086/vo618a-8086102.pdf?src-supplier=Avnet; ComponentLink3Description: https://datasheet.ciiva.com/8086/vo618a-8086102.pdf?src-supplier=Avnet